# EAGLE design Adafruit EYESPI Breakout Board (EAGLE 9.6.2)
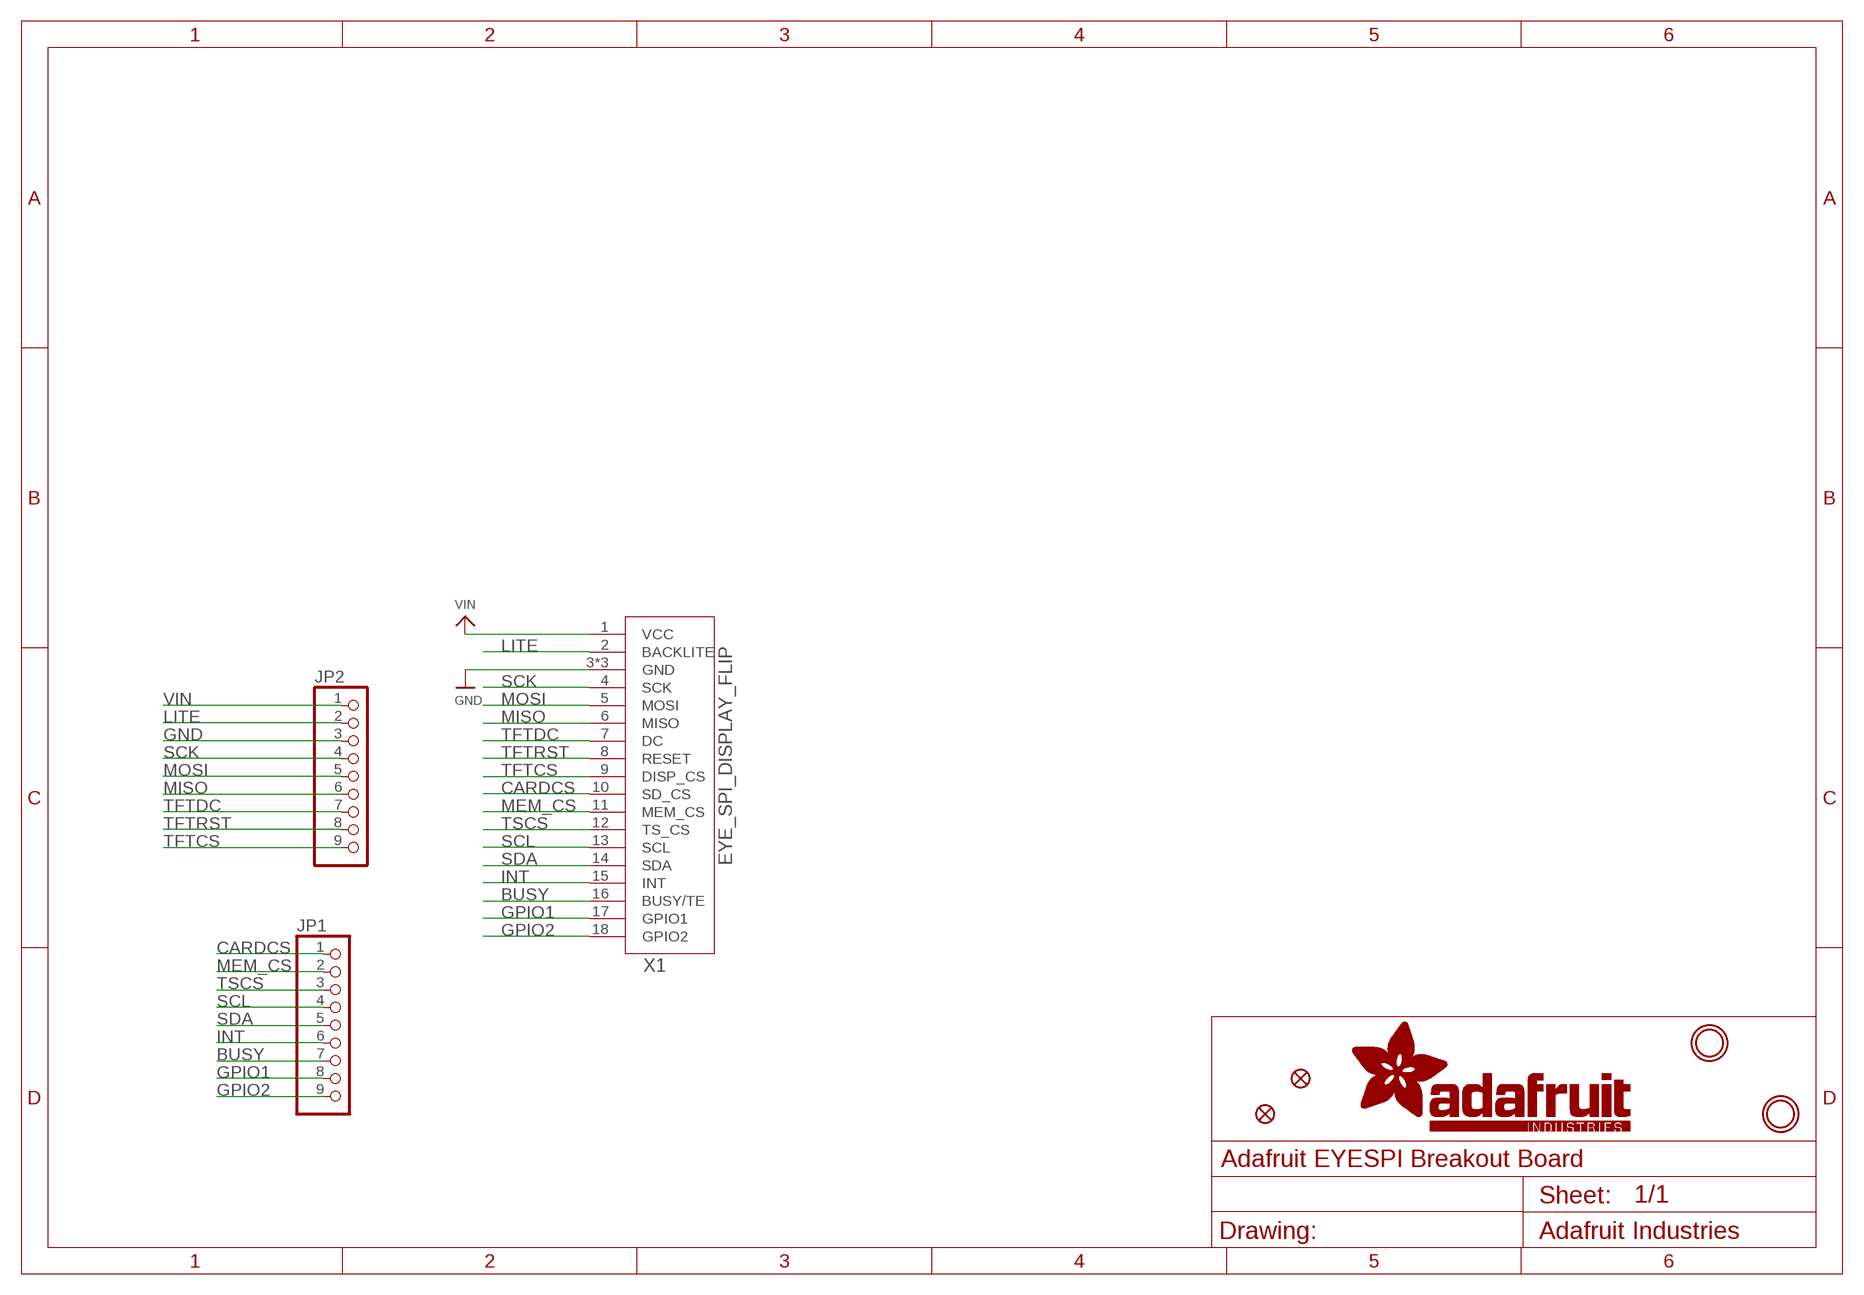
[diagram p0: schematic, sheet 1]

## Parts
JP1  HEADER-1X970MIL  [1X09_ROUND_70]
JP2  HEADER-1X970MIL  [1X09_ROUND_70]
U$4  FIDUCIAL_1MM  [FIDUCIAL_1MM]
U$5  FIDUCIAL_1MM  [FIDUCIAL_1MM]
U$9  MOUNTINGHOLE2.5  [MOUNTINGHOLE_2.5_PLATED]
U$10  MOUNTINGHOLE2.5  [MOUNTINGHOLE_2.5_PLATED]
X1  EYE_SPI_DISPLAY_FLIP  [EYE_SPI_DISPLAY_BOTCONTACT]

## Nets
BUSY: JP1.7 X1.16(BUSY/TE)
CARDCS: JP1.1 X1.10(SD_CS)
GND: JP2.3 X1.3(GND) X1.SUPPORT1(GND) X1.SUPPORT2(GND)
GPIO1: JP1.8 X1.17(GPIO1)
GPIO2: JP1.9 X1.18(GPIO2)
INT: JP1.6 X1.15(INT)
LITE: JP2.2 X1.2(BACKLITE)
MEM_CS: JP1.2 X1.11(MEM_CS)
MISO: JP2.6 X1.6(MISO)
MOSI: JP2.5 X1.5(MOSI)
SCK: JP2.4 X1.4(SCK)
SCL: JP1.4 X1.13(SCL)
SDA: JP1.5 X1.14(SDA)
TFTCS: JP2.9 X1.9(DISP_CS)
TFTDC: JP2.7 X1.7(DC)
TFTRST: JP2.8 X1.8(RESET)
TSCS: JP1.3 X1.12(TS_CS)
VIN [power]: JP2.1 X1.1(VCC)

## Library data of the parts
JP1 JP2 = microbuilder:HEADER-1X9: PIN HEADER
U$4 U$5 = microbuilder:FIDUCIAL: Fiducial Alignment Points Various fiducial points for machine vision alignment.; BOM: EXCLUDE
U$9 U$10 = microbuilder:MOUNTINGHOLE: Mounting Hole For #2 screws (0.086"/2.18mm width, 0.094"/2.4mm hole) use 2.5mm; BOM: EXCLUDE
X1 = adafruit_display:EYE_SPI_DISPLAY; LCSC: C2856802

## Net classes
1 power: width 0.254 mm

## Board
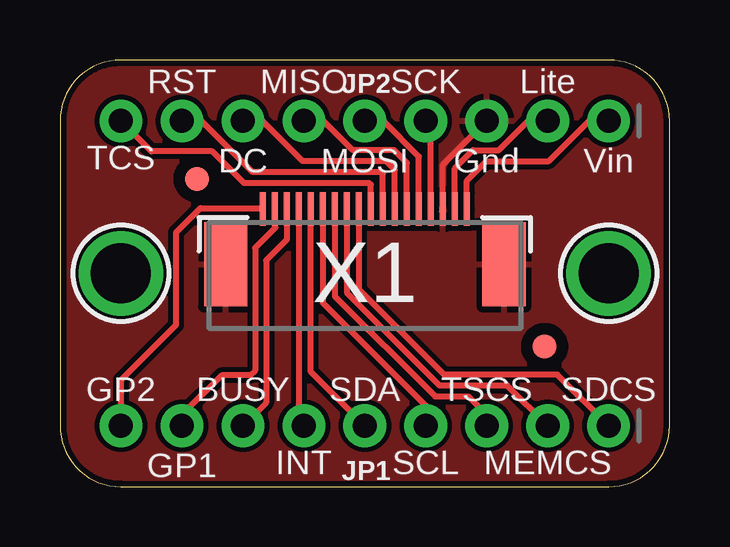
[diagram p1: board, top side]
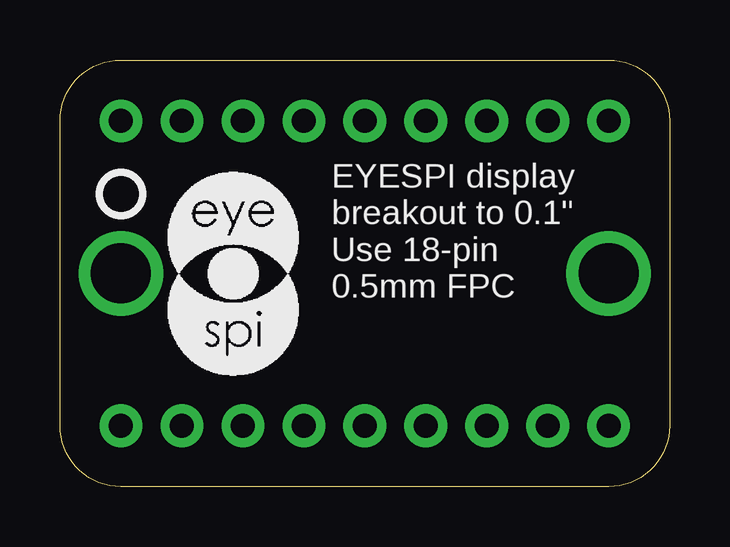
[diagram p2: board, bottom side, seen from below]

Size 25.4 x 17.78 mm. Coordinates in mm from the lower left corner, seen from the top.
Outline: 2.54,0 22.86,0 arc90 25.4,2.54 25.4,15.24 arc90 22.86,17.78 2.54,17.78 arc90 0,15.24 0,2.54 arc90 2.54,0
Copper layers (1*16): Top 0.035mm / dielectric 1.5mm / Bottom 0.035mm
Design rules "adafruit *": minimum track width 8mil, minimum drill 15.5mil, track to track 8mil, track to pad 8mil, pad to pad 8mil, via to via 8mil, smd to smd 8mil, copper to edge 10mil, drill to drill 8mil, minimum pad ring 10mil, minimum via ring 8mil, stop-mask expansion 2mil, vias tented up to drill 20mil, thermal gap 10mil

### Footprints (pad centres in the part's own frame; a part is rotated, then mirrored left to right if it is on the bottom)
1X09_ROUND_70 = drill 1 pad 1.778: 1 -10.16,0; 2 -7.62,0; 3 -5.08,0; 4 -2.54,0; 5 0,0; 6 2.54,0; 7 5.08,0; 8 7.62,0; 9 10.16,0
FIDUCIAL_1MM = smd 1 x 1: 1 0,0
MOUNTINGHOLE_2.5_PLATED = drill 2.5 pad 3.2: P$1 0,0
EYE_SPI_DISPLAY_BOTCONTACT = smd 0.25 x 1.4: 1 4.25,1.154; 2 3.75,1.154; 3 3.25,1.154; 4 2.75,1.154; 5 2.25,1.154; 6 1.75,1.154; 7 1.25,1.154; 8 0.75,1.154; 9 0.25,1.154; 10 -0.25,1.154; 11 -0.75,1.154; 12 -1.25,1.154; 13 -1.75,1.154; 14 -2.25,1.154; 15 -2.75,1.154; 16 -3.25,1.154; 17 -3.75,1.154; 18 -4.25,1.154 | smd 1.8 x 3.5: SUPPORT1 -5.8,-1.152; SUPPORT2 5.8,-1.152

### Placement (x,y rotation side)
JP1  12.7,2.54 180 top
JP2  12.7,15.24 180 top
U$2  [PCBFEAT-REV-040]  22.86,12.19 180 bottom
U$4  20.19,5.84 90 top
U$5  5.71,12.83 180 top
U$9  2.54,8.89 270 top
U$10  22.86,8.89 270 top
U$22  [EYESPI_MINI_LOGO]  20.95,4.57 0 bottom
X1  12.7,10.41 0 top

### Tracks (layer width: path | path; a pad name or v marks a point on that pad's centre or on a via)
BUSY
  Top 0.254: X1.16 9.45,10.3 8.59,9.44 8.59,3.51 JP1.7
CARDCS
  Top 0.254: X1.10 12.45,8.23 16.01,4.67 20.73,4.67 JP1.1
GND
  Top 0.254: X1.3 15.95,13.41 JP2.3
  pour Top: 25.4,17.78 25.4,0 0,0 0,17.78
GPIO1
  Top 0.254: X1.17 8.95,10.81 8.98,10.81 8.13,9.96 8.13,4.83 7.94,4.64 6.73,4.64 5.08,2.99 JP1.8
GPIO2
  Top 0.254: JP1.9 2.54,4.45 4.83,6.73 4.83,10.59 5.85,11.61 8.41,11.61 X1.18
INT
  Top 0.254: X1.15 9.95,2.75 JP1.6
LITE
  Top 0.254: X1.2 16.45,13.26 17.21,14.02 18.29,14.02 19.5,15.24 JP2.2
MEM_CS
  Top 0.254: X1.11 11.95,8.09 15.82,4.22 18.64,4.22 JP1.2
MISO
  Top 0.254: X1.6 14.45,13.49 13.92,14.02 12.2,14.02 10.98,15.24 JP2.6
MOSI
  Top 0.254: X1.5 14.95,13.75 13.46,15.24 JP2.5
SCK
  Top 0.254: X1.4 15.45,15.03 JP2.4
SCL
  Top 0.254: X1.13 10.95,7.67 15.24,3.38 JP1.4
SDA
  Top 0.254: JP1.5 10.45,4.79 X1.14
TFTCS
  Top 0.254: X1.9 12.95,12.58 12.88,12.65 7.67,12.65 6.35,13.97 3.81,13.97 JP2.9
TFTDC
  Top 0.254: X1.7 13.95,13.2 13.59,13.56 10.11,13.56 8.44,15.24 JP2.7
TFTRST
  Top 0.254: X1.8 13.45,13.06 13.4,13.11 8.03,13.11 5.9,15.24 JP2.8
TSCS
  Top 0.254: JP1.3 17.78,2.99 17.02,3.76 15.63,3.76 11.45,7.94 X1.12
VIN
  Top 0.254: X1.1 16.95,12.76 17.75,13.56 20.37,13.56 22.04,15.24 JP2.1

### Text on the board
tPlace: RST | MISO | SCK | Lite | TCS | DC | MOSI | Gnd | Vin | GP2 | BUSY | SDA | TSCS | SDCS | GP1 | INT | SCL | MEMCS
bPlace: EYESPI display / breakout to 0.1" / Use 18-pin / 0.5mm FPC